# Altium schematic sheet Sheet2.SchDoc
size A4
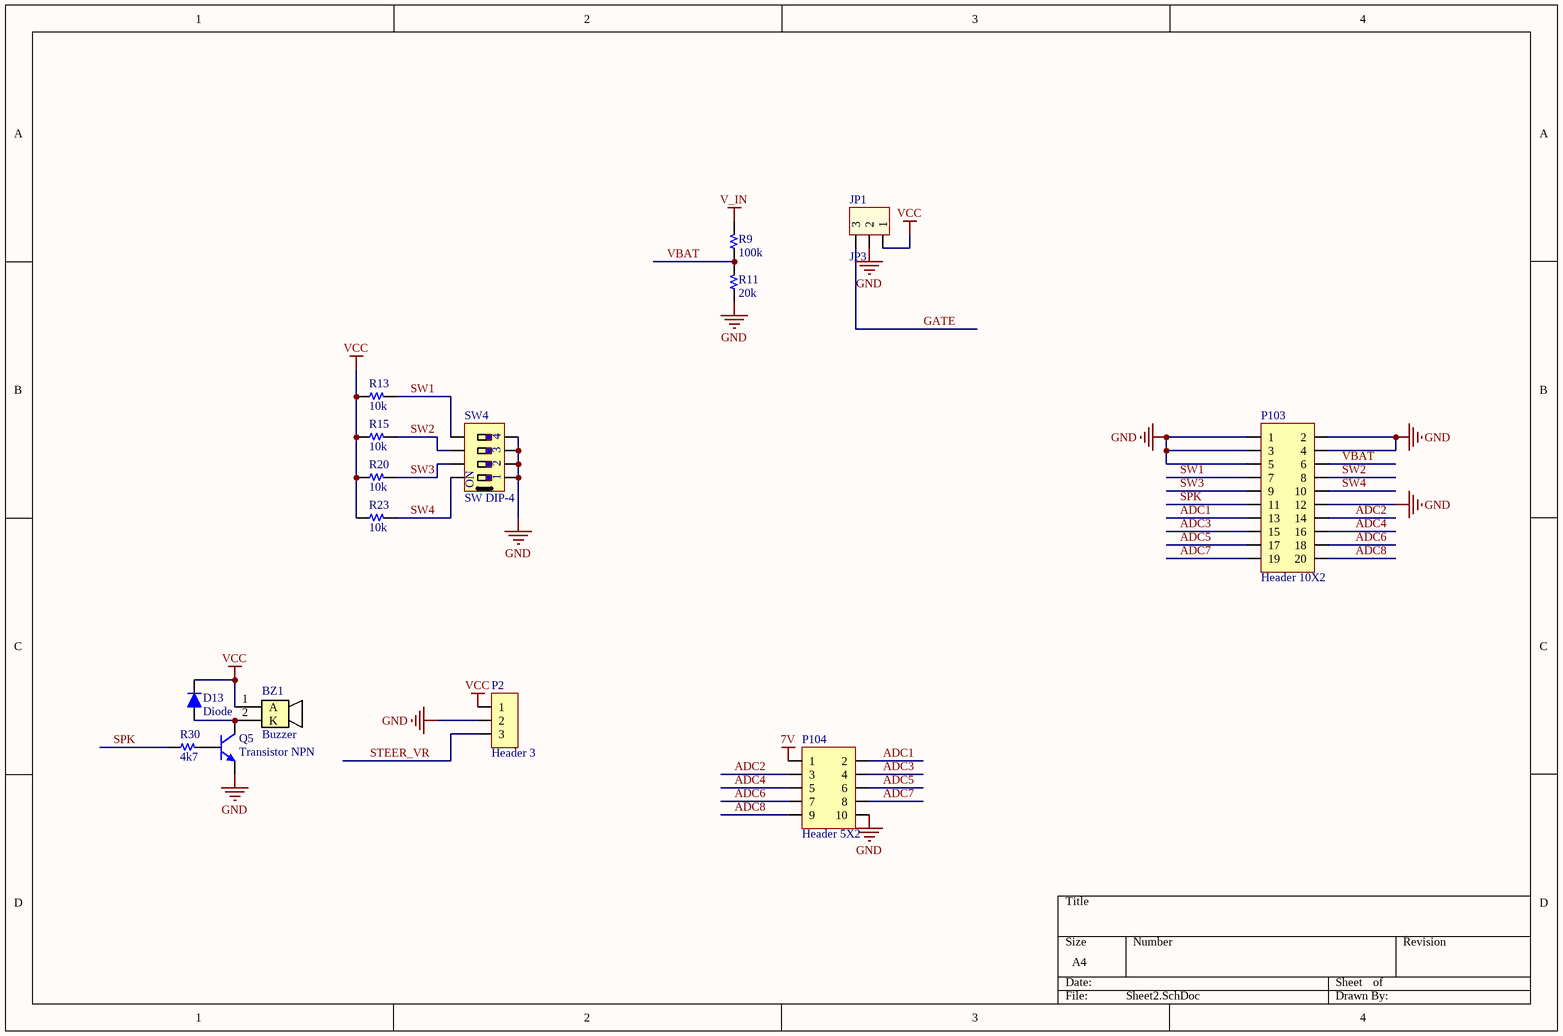
[diagram p0: Sheet2.SchDoc]

## Parts
BZ1  Buzzer  [BUZZER]
D13  Diode  [Diode SOD80C Reflow]
JP1  JP3  [HDR/Header/3/BOX]
P2  Header 3  [HDR/Header/3/BOX]
P103  Header 10X2  [HDR/Header/20/DL]
P104  Header 5X2  [HDR/Header/10/DL/BOX]
Q5  Transistor NPN  [SOT-23]
R9  100k  [R 0805]
R11  20k  [R 0805]
R13  10k  [R 0805]
R15  10k  [R 0805]
R20  10k  [R 0805]
R23  10k  [R 0805]
R30  4k7  [R 0805]
SW4  SW DIP-4  [SW/DIP4]

## Nets
7V: P104.1
GND: JP1.2 P2.2 P103.1 P103.2 P103.3 P103.4 P103.5 P103.12 P104.10 Q5.2(E) R11.1 SW4.1 SW4.2 SW4.3 SW4.4
V_IN: R9.2
VCC: BZ1.1(A) D13.2(K) JP1.1 P2.1 R13.1 R15.1 R20.1 R23.1
ADC1: P103.13 P104.2
ADC2: P103.14 P104.3
ADC3: P103.15 P104.4
ADC4: P103.16 P104.5
ADC5: P103.17 P104.6
ADC6: P103.18 P104.7
ADC7: P103.19 P104.8
ADC8: P103.20 P104.9
GATE: JP1.3
SPK: P103.11 R30.1
STEER_VR: P2.3
SW1: P103.7 R13.2 SW4.5
SW2: P103.8 R15.2 SW4.6
SW3: P103.9 R20.2 SW4.7
SW4: P103.10 R23.2 SW4.8
VBAT: P103.6 R9.1 R11.2
NetBZ1_2: BZ1.2(K) D13.1(A) Q5.3(C)
NetQ5_1: Q5.1(B) R30.2

## Notes on the sheet
- (in symbol SW DIP-4) ON

## Library data of the parts
D13 = Diode: Default Diode
JP1 = Con3: Connector 3; Value: Connector 3
P2 = Header 3: Header, 3-Pin
P103 = Header 10X2: Header, 10-Pin, Dual row
P104 = Header 5X2: Header, 5-Pin, Dual row
Q5 = Transistor NPN: NPN Bipolar Transistor
R9 R11 R13 R15 R20 R23 R30 = Resistor